# Altium schematic sheet Sheet1.SchDoc
size A2; SheetNumber: 1; SheetTotal: 1
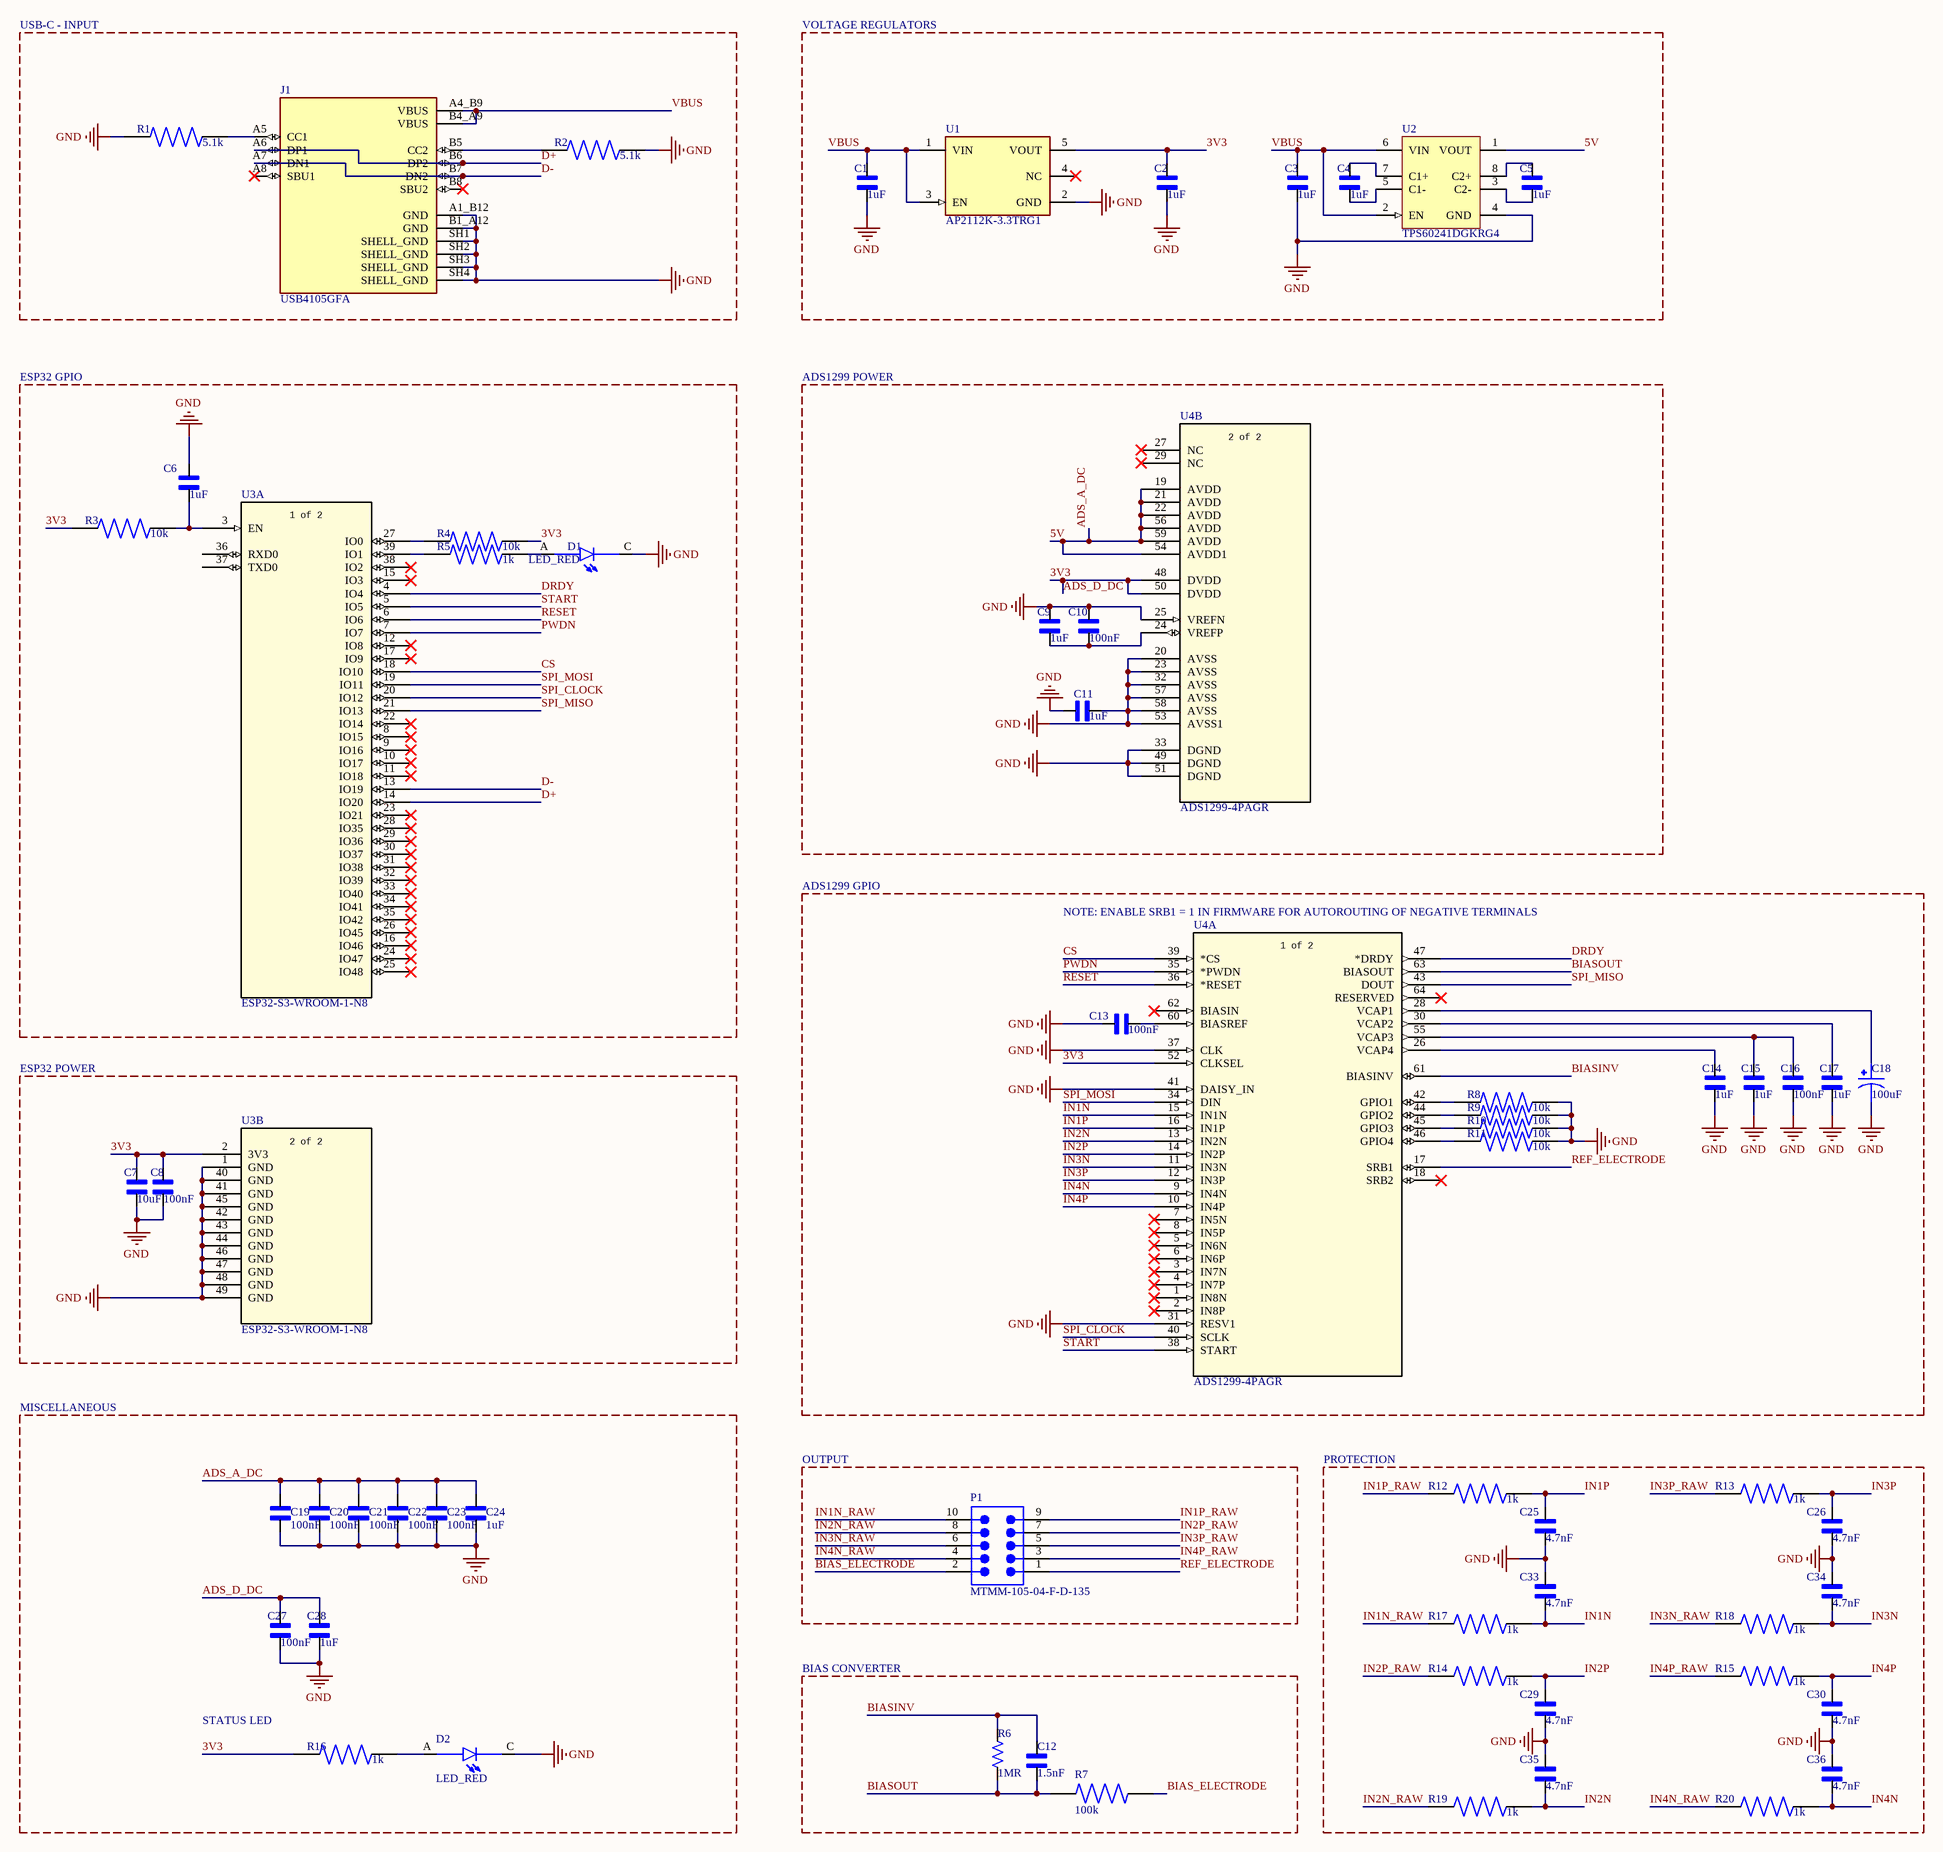
[diagram p0: Sheet1.SchDoc]

## Parts
C1  1uF  [CAPC1608X95]
C2  1uF  [CAPC1608X95]
C3  1uF  [CAPC1608X95]
C4  1uF  [CAPC1608X95]
C5  1uF  [CAPC1608X95]
C6  1uF  [CAPC1608X95]
C7  10uF  [CAPC1608X90]
C8  100nF  [CAPC1608X90N]
C9  1uF  [CAPC1608X95]
C10  100nF  [CAPC1608X90N]
C11  1uF  [CAPC1608X95]
C12  1.5nF  [CAPC1608X87N]
C13  100nF  [CAPC1608X90N]
C14  1uF  [CAPC1608X95]
C15  1uF  [CAPC1608X95]
C16  100nF  [CAPC1608X90N]
C17  1uF  [CAPC1608X95]
C18  100uF  [CAPMP6032X280N]
C19  100nF  [CAPC1608X90N]
C20  100nF  [CAPC1608X90N]
C21  100nF  [CAPC1608X90N]
C22  100nF  [CAPC1608X90N]
C23  100nF  [CAPC1608X90N]
C24  1uF  [CAPC1608X95]
C25  4.7nF  [CAPC1608X90N]
C26  4.7nF  [CAPC1608X90N]
C27  100nF  [CAPC1608X90N]
C28  1uF  [CAPC1608X95]
C29  4.7nF  [CAPC1608X90N]
C30  4.7nF  [CAPC1608X90N]
C33  4.7nF  [CAPC1608X90N]
C34  4.7nF  [CAPC1608X90N]
C35  4.7nF  [CAPC1608X90N]
C36  4.7nF  [CAPC1608X90N]
D1  LED_RED  [LEDC1608X35N]
D2  LED_RED  [LEDC1608X35N]
J1  USB4105GFA  [GCT_USB4105GFA]
P1  MTMM-105-04-F-D-135  [SMTC-MTMM-105-04-X-D-135]
R1  5.1k  [RESC1608X55N]
R2  5.1k  [RESC1608X55N]
R3  10k  [RESC1608X55N]
R4  10k  [RESC1608X55N]
R5  1k  [RESC1608X55N]
R6  1MR  [RESC1508X55N]
R7  100k  [RESC1608X55N]
R8  10k  [RESC1608X55N]
R9  10k  [RESC1608X55N]
R10  10k  [RESC1608X55N]
R11  10k  [RESC1608X55N]
R12  1k  [RESC1608X55N]
R13  1k  [RESC1608X55N]
R14  1k  [RESC1608X55N]
R15  1k  [RESC1608X55N]
R16  1k  [RESC1608X55N]
R17  1k  [RESC1608X55N]
R18  1k  [RESC1608X55N]
R19  1k  [RESC1608X55N]
R20  1k  [RESC1608X55N]
U1  AP2112K-3.3TRG1  [FP-SOT25-IPC_A]
U2  TPS60241DGKRG4  [TI-DGK8_M]
U3  ESP32-S3-WROOM-1-N8  [ESP32-S3-WROOM-1_EXP]  (parts A,B of 2)
U4  ADS1299-4PAGR  [PAG64_TEX]  (parts A,B of 2)

## Blocks framed on the sheet
USB-C - INPUT: J1 R1 R2
VOLTAGE REGULATORS: C1-C5 U1 U2
ESP32 GPIO: C6 D1 R3-R5 U3
ADS1299 POWER: C9-C11 U4
ADS1299 GPIO: C13-C18 R8-R11 U4
ESP32 POWER: C7 C8 U3
OUTPUT: P1
PROTECTION: C25 C26 C29 C30 C33-C36 R12-R15 R17-R20
BIAS CONVERTER: C12 R6 R7

## Nets
GND: C1.2 C2.2 C3.2 C6.1 C7.2 C8.1 C9.1 C10.2 C11.1 C11.2 C13.1 C14.2 C15.2 C16.1 C17.2 C18.2 C19.1 C20.1 C21.1 C22.1 C23.1 C24.2 C25.1 C26.1 C27.1 C28.2 C29.1 C30.1 C33.2 C34.2 C35.2 C36.2 D1.C D2.C J1.A1_B12(GND) J1.B1_A12(GND) J1.SH1(SHELL_GND) J1.SH2(SHELL_GND) J1.SH3(SHELL_GND) J1.SH4(SHELL_GND) R1.1 R2.2 R8.2 R9.2 R10.2 R11.2 U1.2(GND) U2.4(GND) U3.1(GND) U3.40(GND) U3.41(GND) U3.42(GND) U3.43(GND) U3.44(GND) U3.45(GND) U3.46(GND) U3.47(GND) U3.48(GND) U3.49(GND) U4.20(AVSS) U4.23(AVSS) U4.25(VREFN) U4.31(RESV1) U4.32(AVSS) U4.33(DGND) U4.37(CLK) U4.41(DAISY_IN) U4.49(DGND) U4.51(DGND) U4.53(AVSS1) U4.57(AVSS) U4.58(AVSS)
3V3: C2.1 C7.1 C8.2 C27.2 C28.1 R3.1 R4.2 R16.1 U1.5(VOUT) U3.2(3V3) U4.48(DVDD) U4.50(DVDD) U4.52(CLKSEL)  [also labelled ADS_D_DC]
5V: C19.2 C20.2 C21.2 C22.2 C23.2 C24.1 U2.1(VOUT) U4.19(AVDD) U4.21(AVDD) U4.22(AVDD) U4.54(AVDD1) U4.56(AVDD) U4.59(AVDD)  [also labelled ADS_A_DC]
BIAS_ELECTRODE: P1.2 R7.1
BIASINV: C12.2 R6.2 U4.61(BIASINV)
BIASOUT: C12.1 R6.1 R7.2 U4.63(BIASOUT)
CS: U3.18(IO10) U4.39(*CS)
D+: J1.A6(DP1) J1.B6(DP2) U3.14(IO20)
D-: J1.A7(DN1) J1.B7(DN2) U3.13(IO19)
DRDY: U3.4(IO4) U4.47(*DRDY)
IN1N: C33.1 R17.2 U4.15(IN1N)
IN1N_RAW: P1.10 R17.1
IN1P: C25.2 R12.2 U4.16(IN1P)
IN1P_RAW: P1.9 R12.1
IN2N: C35.1 R19.2 U4.13(IN2N)
IN2N_RAW: P1.8 R19.1
IN2P: C29.2 R14.2 U4.14(IN2P)
IN2P_RAW: P1.7 R14.1
IN3N: C34.1 R18.2 U4.11(IN3N)
IN3N_RAW: P1.6 R18.1
IN3P: C26.2 R13.2 U4.12(IN3P)
IN3P_RAW: P1.5 R13.1
IN4N: C36.1 R20.2 U4.9(IN4N)
IN4N_RAW: P1.4 R20.1
IN4P: C30.2 R15.2 U4.10(IN4P)
IN4P_RAW: P1.3 R15.1
PWDN: U3.7(IO7) U4.35(*PWDN)
REF_ELECTRODE: P1.1 U4.17(SRB1)
RESET: U3.6(IO6) U4.36(*RESET)
SPI_CLOCK: U3.20(IO12) U4.40(SCLK)
SPI_MISO: U3.21(IO13) U4.43(DOUT)
SPI_MOSI: U3.19(IO11) U4.34(DIN)
START: U3.5(IO5) U4.38(START)
VBUS: C1.1 C3.1 J1.A4_B9(VBUS) J1.B4_A9(VBUS) U1.1(VIN) U1.3(EN) U2.2(EN) U2.6(VIN)
NetC4_1: C4.1 U2.7(C1+)
NetC4_2: C4.2 U2.5(C1-)
NetC5_1: C5.1 U2.8(C2+)
NetC5_2: C5.2 U2.3(C2-)
NetC6_2: C6.2 R3.2 U3.3(EN)
NetC9_2: C9.2 C10.1 U4.24(VREFP)
NetC13_2: C13.2 U4.60(BIASREF)
NetC14_1: C14.1 U4.26(VCAP4)
NetC15_1: C15.1 C16.2 U4.55(VCAP3)
NetC17_1: C17.1 U4.30(VCAP2)
NetC18_1: C18.1 U4.28(VCAP1)
NetD1_A: D1.A R5.2
NetD2_A: D2.A R16.2
NetJ1_A5: J1.A5(CC1) R1.2
NetJ1_B5: J1.B5(CC2) R2.1
NetR4_1: R4.1 U3.27(IO0)
NetR5_1: R5.1 U3.39(IO1)
NetR8_1: R8.1 U4.42(GPIO1)
NetR9_1: R9.1 U4.44(GPIO2)
NetR10_1: R10.1 U4.45(GPIO3)
NetR11_1: R11.1 U4.46(GPIO4)

Not connected (* = marked no-connect by the designer): J1 A8(SBU1)* B8(SBU2)*; U1 4(NC)*; U3 8(IO15)* 9(IO16)* 10(IO17)* 11(IO18)* 12(IO8)* 15(IO3)* 16(IO46)* 17(IO9)* 22(IO14)* 23(IO21)* 24(IO47)* 25(IO48)* 26(IO45)* 28(IO35)* 29(IO36)* 30(IO37)* 31(IO38)* 32(IO39)* 33(IO40)* 34(IO41)* 35(IO42)* 36(RXD0) 37(TXD0) 38(IO2)*; U4 1(IN8N)* 2(IN8P)* 3(IN7N)* 4(IN7P)* 5(IN6N)* 6(IN6P)* 7(IN5N)* 8(IN5P)* 18(SRB2)* 27(NC)* 29(NC)* 62(BIASIN)* 64(RESERVED)*

## Notes on the sheet
- (near U4) NOTE: ENABLE SRB1 = 1 IN FIRMWARE FOR AUTOROUTING OF NEGATIVE TERMINALS
- MISCELLANEOUS
- STATUS LED
- (in symbol ADS1299-4PAGR, part A) 1 of 2
- (in symbol ADS1299-4PAGR, part B) 2 of 2
- (in symbol ESP32-S3-WROOM-1-N8, part A) 1 of 2
- (in symbol ESP32-S3-WROOM-1-N8, part B) 2 of 2

## Library data of the parts
C1-C6 C9 C11 C14 C15 C17 C24 C28 = 1uF_0603: 1 ÂµF Â±10% 16V Ceramic Capacitor X7R 0603 (1608 Metric); MF: TDK; MP: C1608X7R1C105K; SnapEDA_Link: https://www.snapeda.com/parts/C1608X7R1C105K/TDK/view-part/?ref=snap; Package: 0603 TDK; Value: *; Check_prices: https://www.snapeda.com/parts/C1608X7R1C105K/TDK/view-part/?ref=eda
C7 = 10uF_0603: TACmicrochip,10 uF,6.3 V | AVX TACL106K006RTA; SnapEDA_Link: https://www.snapeda.com/parts/TACL106K006RTA/AVX/view-part/?ref=snap; Package: 603-2 AVX; Value: *; MF: AVX; MP: TACL106K006RTA; Check_prices: https://www.snapeda.com/parts/TACL106K006RTA/AVX/view-part/?ref=eda
C8 C10 C13 C16 C19-C23 C27 = 100nF_0603: Capacitor MLCC 0603 100nF 16V | AVX 0603YC104KAZ2A; SnapEDA_Link: https://www.snapeda.com/parts/0603YC104KAZ2A/AVX/view-part/?ref=snap; Package: 1608 AVX; Value: *; MF: AVX; MP: 0603YC104KAZ2A; Check_prices: https://www.snapeda.com/parts/0603YC104KAZ2A/AVX/view-part/?ref=eda
C12 = 1.5nF_0603: 0603 X7R ceramic capacitor, 100V 1.5nF | KEMET C0603C152K1RACTU; SnapEDA_Link: https://www.snapeda.com/parts/C0603C152K1RACTU/Kemet/view-part/?ref=snap; Package: 1608 KEMET; Value: *; MF: Kemet; MP: C0603C152K1RACTU; Check_prices: https://www.snapeda.com/parts/C0603C152K1RACTU/Kemet/view-part/?ref=eda
C18 = 100uF_tantalum_6032: 100 ÂµF Molded Tantalum Capacitors 10 V 2312 (6032 Metric) 200mOhm; MF: Vishay Sprague; MP: 593D107X9010C2TE3; SnapEDA_Link: https://www.snapeda.com/parts/593D107X9010C2TE3/Vishay/view-part/?ref=snap; Package: Package; Value: *; Check_prices: https://www.snapeda.com/parts/593D107X9010C2TE3/Vishay/view-part/?ref=eda
C25 C26 C29 C30 C33-C36 = 4.7nF_ceramic_0603: C Series 0603 4.7 nF 25 V ±5 % Tolerance C0G SMT Multilayer Ceramic Capacitor; MF: TDK; MP: C1608C0G1E472J080AA; SnapEDA_Link: https://www.snapeda.com/parts/C1608C0G1E472J080AA/TDK/view-part/?ref=snap; Package: 1608 TDK; Value: *; Check_prices: https://www.snapeda.com/parts/C1608C0G1E472J080AA/TDK/view-part/?ref=eda
D1 D2 = LED_RED: Red 631nm LED Indication - Discrete 2V 0603 (1608 Metric); MF: Lite-On Inc.; MP: LTST-C190KRKT; Check_prices: https://www.snapeda.com/parts/LTST-C190KRKT/Lite-On+Inc./view-part/?ref=eda; Value: *; Purchase-URL: https://pricing.snapeda.com/search/part/LTST-C190KRKT/?ref=eda; Price: None; SnapEDA_Link: https://www.snapeda.com/parts/LTST-C190KRKT/Lite-On+Inc./view-part/?ref=snap; Availability: In Stock; Package: 0603 Lite-On
J1 = USB4105GFA: USB-C (USB TYPE-C) USB 2.0 Receptacle Connector 24 (16+8 Dummy) Position Surface Mount, Right Angle; Through Hole; MF: Global Connector Technology; SnapEDA_Link: https://www.snapeda.com/parts/USB4105GFA/Global+Connector+Technology/view-part/?ref=snap; Package: None; Value: *; MP: USB4105GFA; Check_prices: https://www.snapeda.com/parts/USB4105GFA/Global+Connector+Technology/view-part/?ref=eda
P1 = CMP-1029-00113-1: Modified Through-Hole Header, Vertical, -55 to 125 degC, 2 mm Pitch, 10-Pin, Male, RoHS; Manufacturer: Samtec; Pitch: 2 mm; ComponentLink3URL: http://www.samtec.com/documents/webfiles/cpdf/MTMM-1XX-XX-XX-X-XXX-XX-XXX-MKT.pdf; ComponentLink1Description: Manufacturer URL; ComponentLink2Description: Datasheet; Orientation: Vertical; PartNumber: MTMM-105-04-F-D-135; PackageVersion: AE, 12/1993; Mounting Technology: Through-hole; DatasheetVersion: F-214; PackageReference: MTMM-105-04-X-D-135; Temperature Range: -55 to 125 degC; ComponentLink1URL: http://www.samtec.com; ComponentLink3Description: Package Specification; RoHS: True; PackageDescription: 2mm Terminal Strip Assembly; ComponentLink2URL: http://d2a072wq521u33.cloudfront.net/catalog_english//MTMM_TH.PDF
R1 R2 = 5.1kR_0603: Res Thick Film 0603 5.1K Ohm 1% 0.1W(1/10W) Â±100ppm/Â°C Pad SMD Automotive T/R; MF: Yageo; MP: AC0603FR-135K1L; SnapEDA_Link: https://www.snapeda.com/parts/AC0603FR-135K1L/Yageo/view-part/?ref=snap; Package: 1608 Yageo; Value: *; Check_prices: https://www.snapeda.com/parts/AC0603FR-135K1L/Yageo/view-part/?ref=eda
R3 R4 R8-R11 = 10kR_0603: Resistor, AS 0603 10k 1% 100mW TC100 | Bourns CR0603AFX-1002EAS; SnapEDA_Link: https://www.snapeda.com/parts/CR0603AFX-1002EAS/Bourns/view-part/?ref=snap; Package: 0603-2 Bourns; Value: *; MF: Bourns; MP: CR0603AFX-1002EAS; Check_prices: https://www.snapeda.com/parts/CR0603AFX-1002EAS/Bourns/view-part/?ref=eda
R5 R12-R20 = 1kR_0603: DirenÃ§, AS 0603 1k %1 100mW TC100 ¦ Bourns CR0603AFX-1001EAS; SnapEDA_Link: https://www.snapeda.com/parts/CR0603AFX-1001EAS/Bourns/view-part/?ref=snap; Package: 0603-2 Bourns; Value: *; MF: Bourns; MP: CR0603AFX-1001EAS; Check_prices: https://www.snapeda.com/parts/CR0603AFX-1001EAS/Bourns/view-part/?ref=eda
R6 = 1MR_0603: Precision Thin Film Smnt Resistor 0603 Case 1MOhm +/-0.1% 0.063W +/-25ppm/C | TE Connectivity CPF0603B1M0E; Power_Rating: .063 W; Resistance: 1M; Voltage_Rating: 50 V; Tolerance: .1%; SnapEDA_Link: https://www.snapeda.com/parts/CPF0603B1M0E/TE+Connectivity+Passive+Product/view-part/?ref=snap; Package: 0603; Value: *; MF: TE Connectivity; MP: CPF0603B1M0E; EU_RoHS_Compliance: Compliant; Check_prices: https://www.snapeda.com/parts/CPF0603B1M0E/TE+Connectivity+Passive+Product/view-part/?ref=eda
R7 = 100kR_0603: Fixed Resistor CRGCQ 0603 100K 5%; MF: TE Connectivity; MP: CRGCQ0603J100K; SnapEDA_Link: https://www.snapeda.com/parts/CRGCQ0603J100K/TE+Connectivity/view-part/?ref=snap; Package: 0603-2 TE Connectivity; Value: *; Check_prices: https://www.snapeda.com/parts/CRGCQ0603J100K/TE+Connectivity/view-part/?ref=eda
U1 = CMP-12756-000035-1: IC REG LINEAR 3.3V 600MA SOT25; Number of Regulators: 1; Output Type: Fixed; Polarity: Positive; Min Input Voltage: 2.5V; Max Input Voltage: 6V; Accuracy: 1.5%; Quiescent Current: 55uA; Dropout Voltage: 250mV; Min Operating Temperature: -40°C; Length: 3.1mm; Output Current: 600mA; Max Operating Temperature: 85°C; Package Quantity: 1; Output Voltage: 3.3V; Width: 1.7mm; Number of Outputs: 1; Packaging: Tape and Reel; Height: 1.3mm; Lead Free: Lead Free; Max Output Current: 600mA; Case/Package: SOT-23-5; Mount: Surface Mount; Number of Pins: 5
U2 = CMP-0391-00067-1: 5 V, Boost Charge Pump, 25 mA, 2.7 to 5.5 V Input with 2-Cell Alkaline / Nixx Input, -40 to 85 degC, 8-pin SOP (DGK8), Green (RoHS & no Sb/Br); Manufacturer: Texas Instruments; Vin(Max)(V): 5.5; Vout(Max)(V): 5.125; Vin(Min)(V): 2.7; Preset Vout(V): 5; Vout(Min)(V): 4.875; Switching Frequency(Max)(kHz): 220; Iout(Max)(A): 0.025; 2-Cell Alkaline/Nixx Input: TRUE; Iq(Typ)(mA): 0.25; Efficiency(Typ)(%): 90.8; PackageDescription: 8-Pin Thin Small Outline Package 3 x 3 mm Body ,0.65 mm Pitch; ComponentLink3Description: Package Specification; ComponentLink1Description: Manufacturer URL; ComponentLink3URL: http://www.ti.com/litv/pdf/mpds028d; DatasheetVersion: SLVS372B; PackageVersion: 4073329/E; PartNumber: TPS60241DGKRG4; PackageReference: DGK8; ComponentLink2Description: Datasheet; ComponentLink1URL: http://www.ti.com/; Mounting Technology: Surface Mount; Code_JEDEC: MO-187; ComponentLink2URL: http://www.ti.com/general/docs/lit/getliterature.tsp?genericPartNumber=TPS60241&fileType=pdf; Eco-Plan: Green (RoHS & no Sb/Br); Topology: Boost
U3 = ESP32-S3-WROOM-1-N8: Description; Manufacturer_Name: Espressif Systems; Type: Transceiver module; Copyright: Copyright (C) 2026 Ultra Librarian. All rights reserved.; Manufacturer_Part_Number: ESP32-S3-WROOM-1-N8; RefDes: RefDes
U4 = ADS1299-4PAGR: Low-Noise, 4-Channel, 24-Bit Analog-to-Digital Converter for Biopotential Measurements 64-TQFP -40 to 85; Manufacturer_Name: Texas Instruments; Copyright: Copyright (C) 2025 Ultra Librarian. All rights reserved.; Manufacturer_Part_Number: ADS1299-4PAGR; RefDes: RefDes; Type: Type